# Altium schematic sheet OFS.SchDoc
size A; SheetNumber: 3; SheetTotal: 8
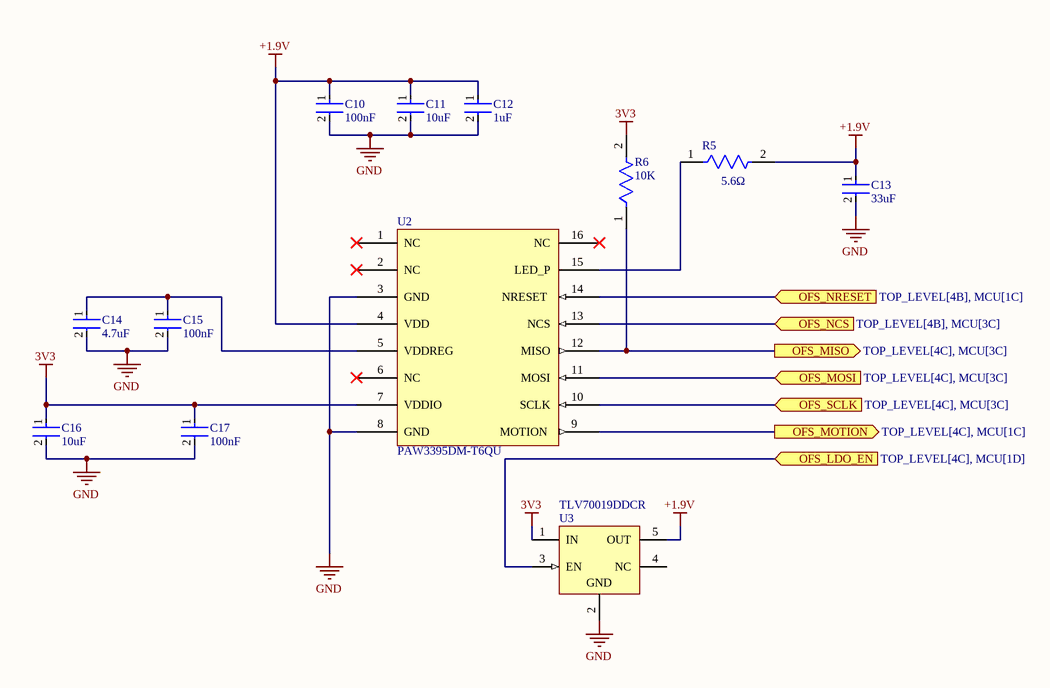
[diagram p0: OFS.SchDoc]

## Parts
C10  100nF  [FP-CL21-IPC_C]
C11  10uF  [FP-CL21-IPC_B]
C12  1uF  [FP-CL10B105KO8NNNC-MFG]
C13  33uF  [FP-C2012-125-0_2-IPC_A]
C14  4.7uF  [FP-CL21-IPC_A]
C15  100nF  [FP-CL21-IPC_C]
C16  10uF  [FP-CL21-IPC_B]
C17  100nF  [FP-CL21-IPC_C]
R5  5.6Ω  [FP-RMCF0603-IPC_A]
R6  10K  [FP-RMCF0805-MFG]
U2  PAW3395DM-T6QU  [PAW3395DM-T6QU]
U3  TLV70019DDCR  [DDC0005A_L]

## Ports
OFS_LDO_EN (in, see TOP_LEVEL[4C], MCU[1D]), OFS_MISO (out, see TOP_LEVEL[4C], MCU[3C]), OFS_MOSI (in, see TOP_LEVEL[4C], MCU[3C]), OFS_MOTION (out, see TOP_LEVEL[4C], MCU[1C]), OFS_NCS (in, see TOP_LEVEL[4B], MCU[3C]), OFS_NRESET (in, see TOP_LEVEL[4B], MCU[1C]), OFS_SCLK (in, see TOP_LEVEL[4C], MCU[3C])

## Nets
3V3: C16.1 C17.1 R6.2 U2.7(VDDIO) U3.1(IN)
+1.9V: C10.1 C11.1 C12.1 C13.1 R5.2 U2.4(VDD) U3.5(OUT)
GND: C10.2 C11.2 C12.2 C13.2 C14.2 C15.2 C16.2 C17.2 U2.3(GND) U2.8(GND) U3.2(GND)
OFS_LDO_EN: U3.3(EN) ; port OFS_LDO_EN
OFS_MISO: R6.1 U2.12(MISO) ; port OFS_MISO
OFS_MOSI: U2.11(MOSI) ; port OFS_MOSI
OFS_MOTION: U2.9(MOTION) ; port OFS_MOTION
OFS_NCS: U2.13(NCS) ; port OFS_NCS
OFS_NRESET: U2.14(NRESET) ; port OFS_NRESET
OFS_SCLK: U2.10(SCLK) ; port OFS_SCLK
NetC14_1: C14.1 C15.1 U2.5(VDDREG)
NetR5_1: R5.1 U2.15(LED_P)

Not connected (* = marked no-connect by the designer): U2 1(NC)* 2(NC)* 6(NC)* 16(NC)*; U3 4(NC)

## Library data of the parts
C10 C15 C17 = CMP-2000-05017-2: CL21 Series 0805 100nF 50V ±10% Tolerance X7R Multilayer Ceramic Chip Capacitor; Depth: 1.25mm; Height: 0.85mm; Width: 0.049inch; Tolerance: 10%; Case Code (Metric): 2012; Case Code (Imperial): 0805; Material: Ceramic; Thickness: 0.037inch; Min Operating Temperature: -55°C; Contact Plating: Tin; Length: 2mm; Mount: Surface Mount; Voltage Rating (DC): 50V; Lead Free: Lead Free; Dielectric: X7R; Radiation Hardening: No; Capacitance: 100nF; Voltage Rating: 50V; Case/Package: 0805; Packaging: Tape and Reel; Max Operating Temperature: 125°C; Voltage: 50V
C11 C16 = CMP-13271-001796-1: CL21 Series 0805 10uF 10V ±10% Tolerance X5R Multilayer Ceramic Chip Capacitor; Lead Free: Lead Free; Packaging: Tape and Reel; Capacitance: 10uF; Case Code (Imperial): 0805; Length: 2mm; Thickness: 0.053inch; Depth: 1.25mm; Mount: Surface Mount; Voltage: 10V; Case/Package: 0805; Dielectric: X5R; Height: 1.25mm; Voltage Rating: 10V; Radiation Hardening: No; Tolerance: 10%; Package Quantity: 3000; Min Operating Temperature: -55°C; Case Code (Metric): 2012; Width: 0.049inch; Max Operating Temperature: 85°C; Termination: Wraparound
C12 = CMP-2000-06093-2: CAP CER 1UF 16V X7R 0603; Manufacturer: Samsung Electro-Mechanics America, Inc; Manufacturer Part Number: CL10B105KO8NNNC; Temperature Coefficient: 15%; Material: Ceramic; Tolerance: 10%; Voltage Rating: 16V; Automotive: No; ComponentLink2Description: Datasheet; Device Class L3: Ceramic Capacitors; Capacitance: 1uF; Temperature Characteristic: X7R; Temperature Range High: +125°C; Digikey Description: CAP CER 1UF 16V X7R 0603; Device Class L2: Capacitors; Octopart: https://octopart.com/cl10b105ko8nnnc-samsung-19018973; ComponentLink2URL: http://www.samsungsem.com/global/front/downloadcms.do?path=%2F%2Fglobal%2F%2Fsupport%2F%2Fproduct-search%2F%2Fmlcc%2F%2F__icsFiles%2F%2Fafieldfile%2F%2F2019%2F%2F06%2F%2F18&fileName=CL10B105KO8NNNC-19.pdf; Lead Free: Yes; Height: 0.9mm; Package: CL10B105KO8NNNC; Temperature Range Low: -55°C; Value: 1uF; Device Class L1: Passive Components; RoHS: TRUE; Temperature: -55°C to +125°C; Category: Cap; Ipc Land Pattern Name: CAPC16080X80
C13 = CMP-08246-003796-1: Multilayer Ceramic Capacitors 33μF ±20% 6.3V X5R SMD 0805; Series: C; Capacitance: 33uF; Min Operating Temperature: -55°C; Depth: 1.25mm; Radiation Hardening: No; Package Quantity: 1; Height: 1.25mm; Max Operating Temperature: 85°C; REACH SVHC: No SVHC; Mount: Surface Mount; Construction: Flat; Case/Package: 0805; Dielectric Material: Ceramic; Thickness: 0.057inch; Case Code (Imperial): 0805; Lead Free: Lead Free; Weight: 0.000194oz; Case Code (Metric): 2012; Tolerance: 20%; Dielectric: X5R; RoHS Compliant: Yes; Length: 2mm; Packaging: Tape and Reel; Voltage Rating (DC): 6.3V; Width: 1.2mm; Resistor Type: Ceramic; Termination: SMD/SMT; Voltage Rating: 6.3V
C14 = CMP-13271-002624-1: CL21 Series 0805 4.7uF 25V ±10% Tolerance X5R Multilayer Ceramic Chip Capacitor; Case Code (Imperial): 0805; Thickness: 0.055inch; Mount: Surface Mount; Case Code (Metric): 2012; Capacitance: 4.7uF; Depth: 1.25mm; Lead Free: Lead Free; Case/Package: 0805; Voltage Rating: 25V; Package Quantity: 1; Width: 0.049inch; Radiation Hardening: No; Voltage Rating (DC): 25V; Length: 2mm; Dielectric: X5R; Height: 1.25mm; Packaging: Tape and Reel; Tolerance: 10%; Min Operating Temperature: -55°C; Max Operating Temperature: 85°C
R5 = CMP-26527-007122-1: 5.6Ω ±1% 0.1W 0603 Thick Film Chip Resistor AEC-Q200 compliant; Resistance: 5.6R; Max Power Dissipation: 100mW; Temperature Coefficient: 200ppm/°C; Tolerance: 1%; Case/Package: 0603; Max Operating Temperature: 155°C; Radiation Hardening: No; Length: 0.061inch; Mount: Surface Mount; Series: RMCF; Contact Plating: Tin; Packaging: Tape and Reel; Number of Terminations: 2; Min Operating Temperature: -55°C; Height: 0.022inch; Case Code (Imperial): 0603; RoHS Compliant: Yes; Case Code (Metric): 1608; Resistor Type: Thick Film; Features: Automotive AEC-Q200; Width: 0.031inch
R6 = CMP-26527-000121-1: RES 10K OHM 1% 1/8W 0805; Power Rating: 125mW; Resistance: 10kR; Temperature Coefficient: 100ppm/°C; Depth: 1.25mm; Construction: Rectangular; Packaging: Tape and Reel; Tolerance: 1%; Lead Free: Lead Free; Case/Package: 0805; RoHS Compliant: Yes; Series: RMCF; Width: 0.049inch; Max Power Dissipation: 125mW; Contact Plating: Tin; Height: 0.026inch; Mount: Surface Mount; Resistor Type: Thick Film; Size Code: 0805; Length: 2mm; Max Operating Temperature: 155°C; Features: Automotive AEC-Q200; Radiation Hardening: No; Case Code (Imperial): 0805; Min Operating Temperature: -55°C; Case Code (Metric): 2012; Number of Terminations: 2; Military Standard: Not
U2 = PAW3395DM-T6QU: PixArt PAW3395DM-T6QU optical navigation sensor, 16-pin molded lead-frame DIP, 1.78mm pitch staggered dual row, 10.7mm row spacing, through-hole
U3 = CMP-0394-01054-2: Single Output LDO, 200 mA, Fixed 1.9 V Output, 2 to 5.5 V Input, with Low IQ, 5-pin SOT (DDC), -40 to 125 degC, Green (RoHS & no Sb/Br); Manufacturer: Texas Instruments; Iq(Typ)(mA): 0.03; Vin(Max)(V): 5.5; Accuracy(%): 2; Vout Adj(Min)(V): 1.9; Iout(Max)(A): 0.2; SubFamily: Single Channel LDO; Vdo(Typ)(mV): 175; ComponentLink2Description: Datasheet; PackageReference: DDC0005A; DatasheetVersion: SLVSA00D; ComponentLink3Description: Package Specification; ComponentLink2URL: http://www.ti.com/general/docs/lit/getliterature.tsp?genericPartNumber=TLV70019&fileType=pdf; PartNumber: TLV70019DDCR; PackageVersion: 4204403-2/E; Code_JEDEC: MO-193; ComponentLink1URL: http://www.ti.com/; Eco-Plan: Green (RoHS & no Sb/Br); PackageDescription: 5-Pin Plastic Small Outline, Body 2.9 x 1.6 mm, 0.95 mm Pitch; Fixed Output Options(V): 1.9; Vout Adj(Max)(V): 1.9; Vin(Min)(V): 2; Mounting Technology: Surface Mount; ComponentLink1Description: Manufacturer URL; ComponentLink3URL: http://www.ti.com/litv/pdf/mpds123d